# Altium schematic sheet ESP32.SchDoc
size A; SheetNumber: 3; SheetTotal: 6
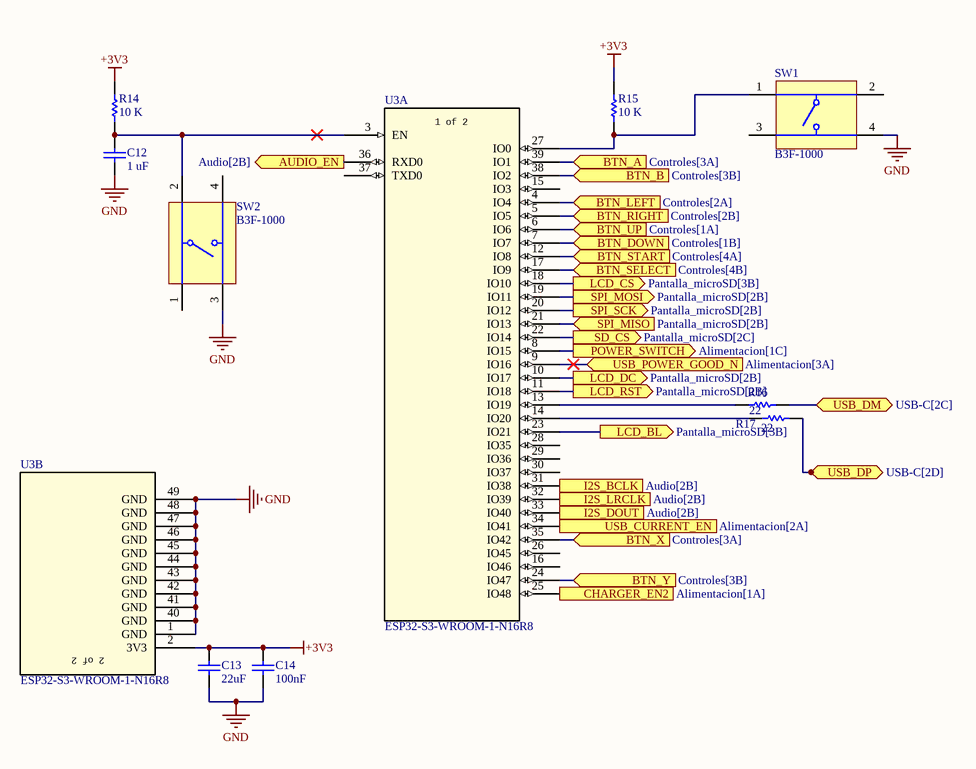
[diagram p0: ESP32.SchDoc]

## Parts
C12  1 uF  [CAP 1206_3216]
C13  value 22uF  [CAP 1206_3216]  (hidden comment: Capacitor)
C14  value 100nF  [CAP 1206_3216]  (hidden comment: Capacitor)
R14  10 k  [RES 0805_2012]
R15  10 k  [RES 0805_2012]
R16  value 22  [RES 0805_2012]  (hidden comment: Resistor)
R17  value 22  [RES 0805_2012]  (hidden comment: Resistor)
SW1  B3F-1000  [OMRON-B3F-1000-4_V]
SW2  B3F-1000  [OMRON-B3F-1000-4_V]
U3  ESP32-S3-WROOM-1-N16R8  [ESP32-S3-WROOM-1_EXP]  (parts A,B of 2)

## Ports
AUDIO_EN (out, see Audio[2B]), BTN_A (in, see Controles[3A]), BTN_B (in, see Controles[3B]), BTN_DOWN (in, see Controles[1B]), BTN_LEFT (in, see Controles[2A]), BTN_RIGHT (in, see Controles[2B]), BTN_SELECT (in, see Controles[4B]), BTN_START (in, see Controles[4A]), BTN_UP (in, see Controles[1A]), BTN_X (in, see Controles[3A]), BTN_Y (in, see Controles[3B]), CHARGER_EN2 (out, see Alimentacion[1A]), I2S_BCLK (out, see Audio[2B]), I2S_DOUT (out, see Audio[2B]), I2S_LRCLK (out, see Audio[2B]), LCD_BL (out, see Pantalla_microSD[3B]), LCD_CS (out, see Pantalla_microSD[3B]), LCD_DC (out, see Pantalla_microSD[2B]), LCD_RST (out, see Pantalla_microSD[2B]), POWER_SWITCH (out, see Alimentacion[1C]), SD_CS (out, see Pantalla_microSD[2C]), SPI_MISO (in, see Pantalla_microSD[2B]), SPI_MOSI (out, see Pantalla_microSD[2B]), SPI_SCK (out, see Pantalla_microSD[2B]), USB_CURRENT_EN (out, see Alimentacion[2A]), USB_DM (bidir, see USB-C[2C]), USB_DP (bidir, see USB-C[2D]), USB_POWER_GOOD_N (in, see Alimentacion[3A])

## Nets
+3V3: C13.2 C14.1 R14.2 R15.2 U3.2(3V3)
GND: C12.1 C13.1 C14.2 SW1.4 SW2.3 U3.1(GND) U3.40(GND) U3.41(GND) U3.42(GND) U3.43(GND) U3.44(GND) U3.45(GND) U3.46(GND) U3.47(GND) U3.48(GND) U3.49(GND)
AUDIO_EN: U3.36(RXD0) ; port AUDIO_EN
BTN_A: U3.39(IO1) ; port BTN_A
BTN_B: U3.38(IO2) ; port BTN_B
BTN_DOWN: U3.7(IO7) ; port BTN_DOWN
BTN_LEFT: U3.4(IO4) ; port BTN_LEFT
BTN_RIGHT: U3.5(IO5) ; port BTN_RIGHT
BTN_SELECT: U3.17(IO9) ; port BTN_SELECT
BTN_START: U3.12(IO8) ; port BTN_START
BTN_UP: U3.6(IO6) ; port BTN_UP
BTN_X: U3.35(IO42) ; port BTN_X
BTN_Y: U3.24(IO47) ; port BTN_Y
CHARGER_EN2: U3.25(IO48) ; port CHARGER_EN2
I2S_BCLK: U3.31(IO38) ; port I2S_BCLK
I2S_DOUT: U3.33(IO40) ; port I2S_DOUT
I2S_LRCLK: U3.32(IO39) ; port I2S_LRCLK
LCD_BL: U3.23(IO21) ; port LCD_BL
LCD_CS: U3.18(IO10) ; port LCD_CS
LCD_DC: U3.10(IO17) ; port LCD_DC
LCD_RST: U3.11(IO18) ; port LCD_RST
POWER_SWITCH: U3.8(IO15) ; port POWER_SWITCH
SD_CS: U3.22(IO14) ; port SD_CS
SPI_MISO: U3.21(IO13) ; port SPI_MISO
SPI_MOSI: U3.19(IO11) ; port SPI_MOSI
SPI_SCK: U3.20(IO12) ; port SPI_SCK
USB_CURRENT_EN: U3.34(IO41) ; port USB_CURRENT_EN
USB_DM: R16.2 ; port USB_DM
USB_DP: R17.2 ; port USB_DP
USB_POWER_GOOD_N: U3.9(IO16) ; port USB_POWER_GOOD_N
NetC12_2: C12.2 R14.1 SW2.2 U3.3(EN)
NetR15_1: R15.1 SW1.1 U3.27(IO0)
NetR16_1: R16.1 U3.13(IO19)
NetR17_1: R17.1 U3.14(IO20)

Not connected (* = marked no-connect by the designer): SW1 2 3; SW2 1 4; U3 15(IO3) 16(IO46) 26(IO45) 28(IO35) 29(IO36) 30(IO37) 37(TXD0)

## Notes on the sheet
- Title:
- Date:
- Size:
- A3
- Number:
- Institution:
- Universidad Anáhuac Querétaro
- Drawn by:
- Marco Antonio Guereca Soto
- Check by:
- Morrison Ernesto Rodríguez Gutiérrez
- (in symbol ESP32-S3-WROOM-1-N16R8, part A) 1 of 2
- (in symbol ESP32-S3-WROOM-1-N16R8, part B) 2 of 2

## Library data of the parts
C12-C14 = Capacitor: SimulationGenericComponent: True
  C12: Value: 1 uF
R14-R17 = Resistor: TC1: 0; SimulationGenericComponent: True; TC2: 0
  R14 R15: Value: 10 K
SW1 SW2 = CMP-1677-00002-1: Tactile Switch, SPST-NO, 0.05 A, 5 to 24 V, -25 to 70 degC, 4-Pin THD, RoHS, Bulk; Shielding: Shielded; Gender: Female; Capacitance: -45 f; Voltage Rating: 150 V; Current Rating: 1.5 A; Radiation Hardening: No; Contact Plating: Gold; Height: 14.99 mm; Min Operating Temperature: -40 degC; Packaging: Tray; ComponentLink2Description: Datasheet; ComponentLink1URL: http://www.omron.com/; Lead Pitch: 1.27 mm; RoHSCompliant: true; Pins: 8; PackageReference: B3F-1000; Width: 25.4 mm; Contact Material: Brass; ComponentLink2URL: http://www.omron.com/ecb/products/pdf/en-b3f.pdf; PackageDescription: 4-Pin Through Hole Device, Body 6 x 6 mm; DatasheetVersion: Jan-15; ComponentLink1Description: Manufacturer URL; Package Quantity: 1080; Mount: Through Hole; Length: 18.34 mm; Max Operating Temperature: 70 degC
U3 = ESP32-S3-WROOM-1-N16R8: Description; Manufacturer_Name: Espressif Systems; Copyright: Copyright (C) 2026 Ultra Librarian. All rights reserved.; Manufacturer_Part_Number: ESP32-S3-WROOM-1-N16R8; RefDes: RefDes; Type: Type